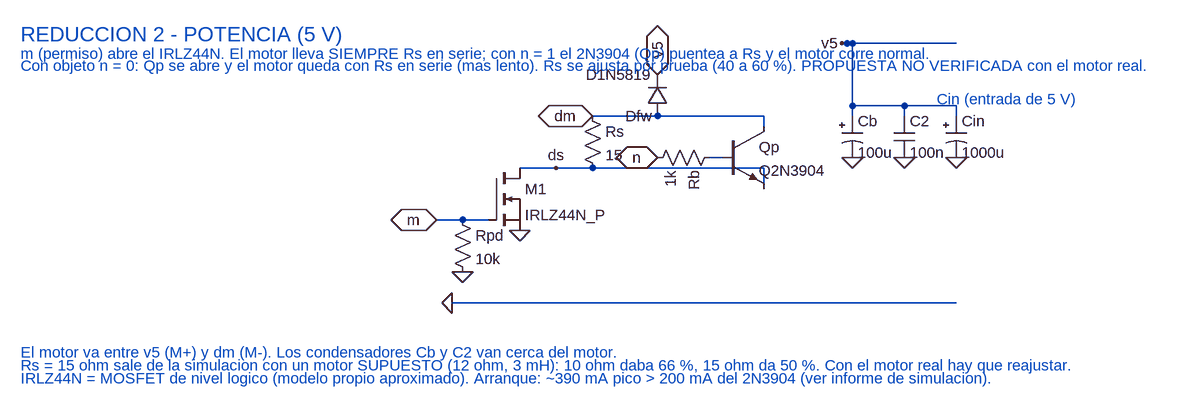
[diagram p0: schematic BLOQUE_POTENCIA_R2.asc]
BLOQUE_POTENCIA_R2.asc, the LTspice schematic file:
Version 4
SHEET 1 1500 600
WIRE 640 96 560 96
WIRE 688 16 800 16
WIRE 800 16 1064 16
WIRE 800 -64 900 -64
WIRE 900 -64 1064 -64
WIRE 1064 -64 1064 -48
WIRE 1064 48 1064 16
WIRE 980 0 1000 0
WIRE 1184 -176 1360 -176
WIRE 1184 -176 1192 -176
WIRE 1200 -64 1200 -176
WIRE 1280 -64 1280 -80
WIRE 1280 -80 1200 -80
WIRE 1360 -64 1360 -80
WIRE 1360 -80 1280 -80
WIRE 584 224 1360 224
FLAG 560 96 m
FLAG 600 176 0
FLAG 688 112 0
FLAG 744 16 ds
FLAG 800 -64 dm
FLAG 900 -128 v5
FLAG 900 0 n
FLAG 1200 0 0
FLAG 1360 0 0
FLAG 1280 0 0
FLAG 1184 -176 v5
FLAG 584 224 0
IOPIN 560 96 BiDir
IOPIN 800 -64 BiDir
IOPIN 900 -128 BiDir
IOPIN 900 0 BiDir
SYMBOL res 584 80 R0
SYMATTR InstName Rpd
SYMATTR Value 10k
SYMBOL nmos 640 16 R0
SYMATTR InstName M1
SYMATTR Value IRLZ44N_P
SYMBOL res 784 -80 R0
SYMATTR InstName Rs
SYMATTR Value 15
SYMBOL diode 916 -64 R180
SYMATTR InstName Dfw
SYMATTR Value D1N5819
SYMBOL npn 1000 -48 R0
SYMATTR InstName Qp
SYMATTR Value Q2N3904
SYMBOL res 996 -16 R90
SYMATTR InstName Rb
SYMATTR Value 1k
SYMBOL polcap 1184 -64 R0
SYMATTR InstName Cb
SYMATTR Value 100u
SYMBOL polcap 1344 -64 R0
SYMATTR InstName Cin
SYMATTR Value 1000u
SYMBOL cap 1264 -64 R0
SYMATTR InstName C2
SYMATTR Value 100n
TEXT -80 -190 Left 3 ;REDUCCION 2 - POTENCIA (5 V)
TEXT -80 -160 Left 2 ;m (permiso) abre el IRLZ44N. El motor lleva SIEMPRE Rs en serie; con n = 1 el 2N3904 (Qp) puentea a Rs y el motor corre normal.
TEXT -80 -142 Left 2 ;Con objeto n = 0: Qp se abre y el motor queda con Rs en serie (mas lento). Rs se ajusta por prueba (40 a 60 %). PROPUESTA NO VERIFICADA con el motor real.
TEXT 1330 -90 Left 2 ;Cin (entrada de 5 V)
TEXT -80 300 Left 2 ;El motor va entre v5 (M+) y dm (M-). Los condensadores Cb y C2 van cerca del motor.
TEXT -80 320 Left 2 ;Rs = 15 ohm sale de la simulacion con un motor SUPUESTO (12 ohm, 3 mH): 10 ohm daba 66 %, 15 ohm da 50 %. Con el motor real hay que reajustar.
TEXT -80 340 Left 2 ;IRLZ44N = MOSFET de nivel logico (modelo propio aproximado). Arranque: ~390 mA pico > 200 mA del 2N3904 (ver informe de simulacion).

The netlist it stands for:
* BLOQUE_POTENCIA_R2.asc
Rpd m 0 10k
M1 ds m 0 0 IRLZ44N_P
Rs dm ds 15
Dfw dm v5 D1N5819
Qp dm N001 ds 0 Q2N3904
Rb N001 n 1k
Cb v5 0 100u
Cin v5 0 1000u
C2 v5 0 100n
.model D D
.lib standard.dio
.model NPN NPN
.model PNP PNP
.lib standard.bjt
.model NMOS NMOS
.model PMOS PMOS
.lib standard.mos
* REDUCCION 2 - POTENCIA (5 V)
* m (permiso) abre el IRLZ44N. El motor lleva SIEMPRE Rs en serie; con n = 1 el 2N3904 (Qp) puentea a Rs y el motor corre normal.
* Con objeto n = 0: Qp se abre y el motor queda con Rs en serie (mas lento). Rs se ajusta por prueba (40 a 60 %). PROPUESTA NO VERIFICADA con el motor real.
* Cin (entrada de 5 V)
* El motor va entre v5 (M+) y dm (M-). Los condensadores Cb y C2 van cerca del motor.
* Rs = 15 ohm sale de la simulacion con un motor SUPUESTO (12 ohm, 3 mH): 10 ohm daba 66 %, 15 ohm da 50 %. Con el motor real hay que reajustar.
* IRLZ44N = MOSFET de nivel logico (modelo propio aproximado). Arranque: ~390 mA pico > 200 mA del 2N3904 (ver informe de simulacion).
.backanno
.end